# Altium schematic sheet Power Regulation.SchDoc
size A4; DrawnBy: Adam Szautner; Revision: 1.0; SheetNumber: 1; SheetTotal: 3; prg: Quantum Key Distribution; prj: Laser Driver; PN: QKD-LD-001; SPICEModelCacheNLWIOUNF: <root> / <DocumentId>NLWIOUNF</DocumentId> / <CacheFrame Number="0"> / <Model Name="emk325b7475_nht" Kind="CKT"> / <Text>* EMK325B7475_NHT     SPICE MODEL  ( General Type ) / *-------------------------------------------------------------------------------------------------------- / * Model Generated by TAIYO YUDEN Corporation (http://www.ty-top.com) / * Version 1.0 / * TAIYO YUDEN Control No. 170613 / * Copyright(c) 2017 TAIYO YUDEN CO.,LTD. All Rights Reserved. / *-------------------------------------------------------------------------------------------------------- / * / * Products Name : Multilayer Ceramic Capacitors / * / * Characteristics : / *     Capacitance : 4.7 uF , Rated Voltage : 16V , TCC : X7R / *     Case Size : 3.2 x 2.5 / 0.126 x 0.098 [mm/inch] , Thickness : 1.9 / 0.075 [mm/inch] / *     (Conditions: Temperature = 25 degC , DC Bias Current/Voltage = 0A / 0V) / * / * Frequency Range : 40Hz - 3GHz / * / * External Node Assignments : / * / *  1  o---| |---o  2 / * / *-------------------------------------------------------------------------------------------------------- / .SubCkt EMK325B7475_NHT 1 2 / **************************** / C0 1 110 4.4322u / Cm 1 101 0.18549u / C1 101 102 0.5166u / Rc1 101 102 1.212k / C2 102 103 0.23246u / Rc2 102 103 324.4 / C3 103 110 0.044161u / Rc3 103 110 17.632 / C2m 1 301 0.22169u / C21 301 302 1.4263u / Rc21 301 302 2.8865k / C22 302 303 0.94554u / Rc22 302 303 3.6708k / C23 303 304 0.89694u / Rc23 303 304 3.8182k / C24 304 305 0.63775u / Rc24 304 305 327.79 / C25 305 306 0.52201u / Rc25 305 306 313.07 / C26 306 307 0.23625u / Rc26 306 307 60.171 / C27 307 308 0.21382u / Rc27 307 308 30.452 / C28 308 309 0.12573u / Rc28 308 309 51.023 / C29 309 110 4272.8p / Rc29 309 110 13.367 / Rp0 1 110 106.382978723404Meg / L0 110 120 0.15544n / Lm 120 130 0.41806n / L1 120 121 0.46753n / RL1 121 130 0.26517 / L2 120 122 0.47905n / RL2 122 130 0.25841 / L3 120 123 0.81633n / RL3 123 130 40.755 / CR 120 124 1.2488u / LR 124 125 0.3236n / RR 125 130 24.837m / CL 130 140 3.3935p / LL 130 140 0.14146n / RL 130 140 14.873 / Rs 140 2 4.0745m / **************************** / .ends EMK325B7475_NHT</Text> / </Model> / </CacheFrame> / </root>
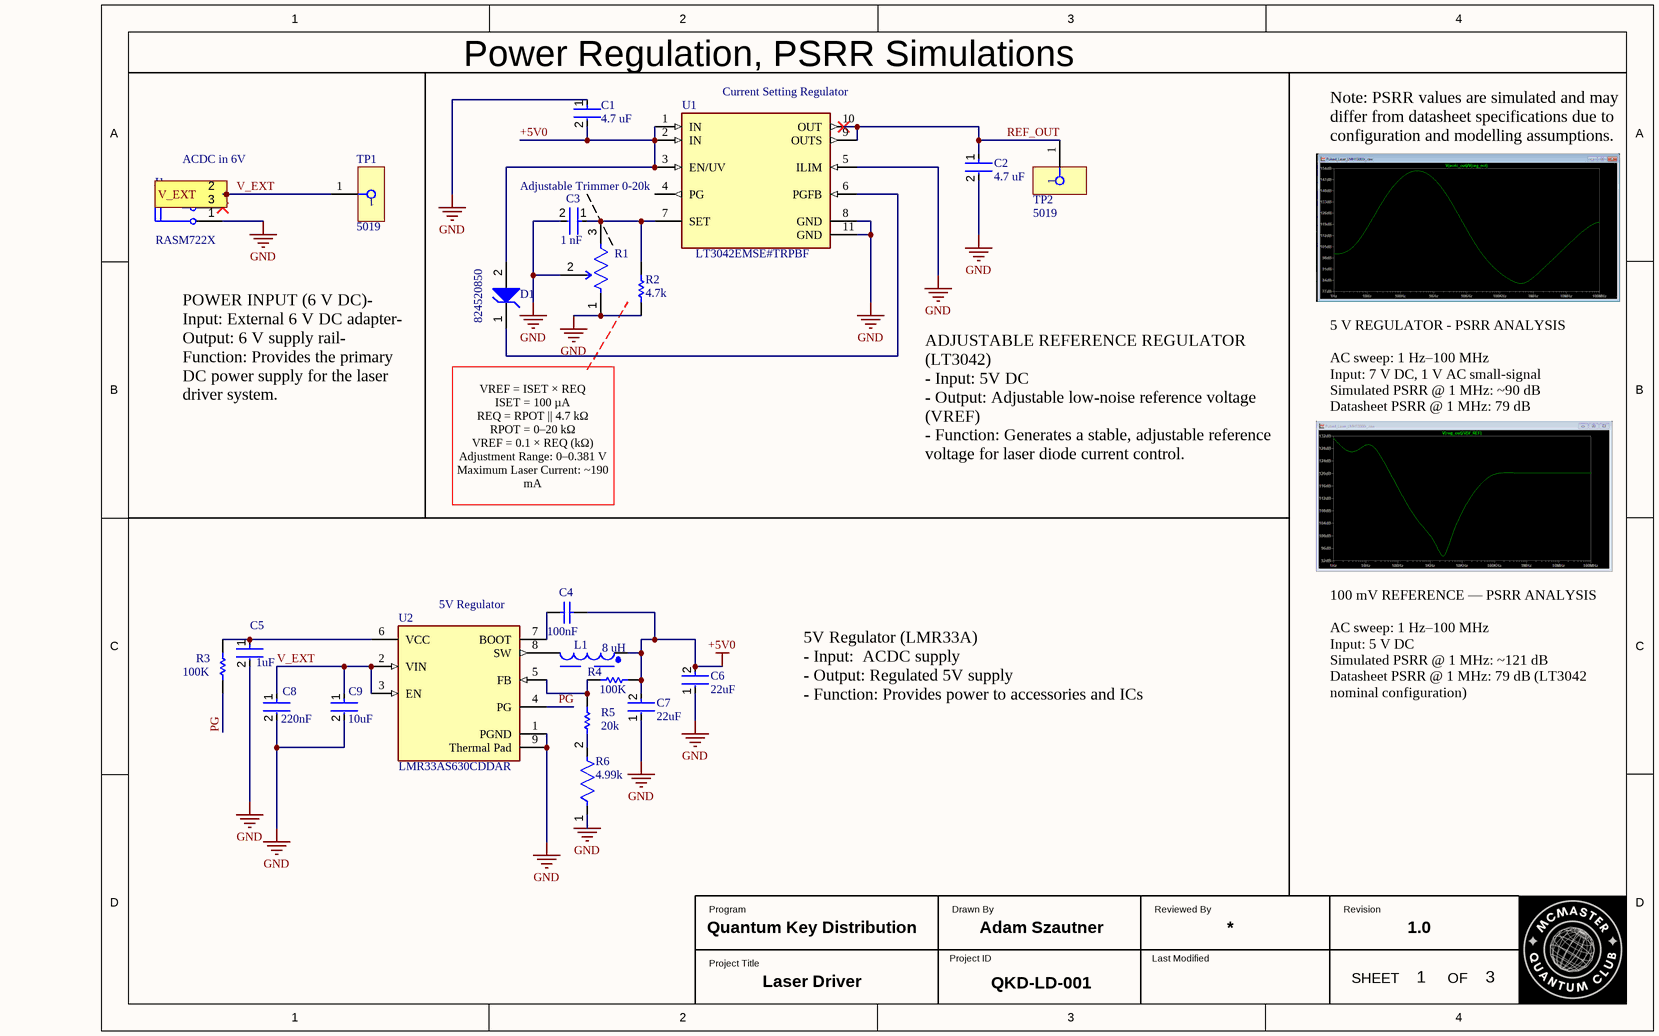
[diagram p0: Power Regulation.SchDoc]

## Parts
C1  4.7 uF  [FP-1210-L_3_2_0_3-W_2_5_0-MFG]
C2  4.7 uF  [FP-1210-L_3_2_0_3-W_2_5_0-MFG]
C3  1 nF  [FP-0201-L_0_6_0_03-W_0_3-IPC_C]
C4  100nF  [CAPC2013X145X50LL20T20]
C5  1uF  [FP-0402-L_1_0_0_05-W_0_5-IPC_B]
C6  22uF  [FP-GCM32E-0_35-e0_3_1_275-MFG]
C7  22uF  [FP-GCM32E-0_35-e0_3_1_275-MFG]
C8  220nF  [FP-C0603C-CF-MFG]
C9  10uF  [FP-GCJ31C-0_4-IPC_C]
D1  824520850  [WE-TVSP_DO-214AA_Unidirectional]
J1  RASM722X  [SWIT-RASM722X_V]
L1  8 uH  [WE-XHMI_1060 P]
R1  Adjustable Trimmer 0-20k  [FP-3269W-MFG]
R2  4.7k  [RESC1609X50X30NL10T20]
R3  100K  [RESC0603(1608)_N]
R4  100K  [RESC0603(1608)_N]
R5  20k  [RESC3116X65X40ML10T20]
R6  4.99k  [FP-CRCW1210-e3-IPC_B]
TP1  5019  [5019_MFG]
TP2  5019  [5019_MFG]
U1  LT3042EMSE#TRPBF  [FP-MSE-10-05-08-1664-IPC_A]
U2  LMR33AS630CDDAR  [FP-DDA0008J-IPC_B]

## Ports
V_EXT (in)

## Nets
+5V0: C1.2 C4.1 C6.2 C7.2 D1.2(A) L1.1 R4.2 U1.1(IN) U1.2(IN) U1.3(EN/UV)
GND: C1.1 C2.2 C3.2 C5.2 C6.1 C7.1 C8.2 C9.2 J1.1(SLEEVE) R1.1(CCW) R1.2(WIPER) R2.1 R6.1 U1.5(ILIM) U1.8(GND) U1.11(GND) U2.1(PGND) U2.9(Thermal_Pad)
PG: R3.1 U2.4(PG)
REF_OUT: C2.1 TP2.1 U1.9(OUTS) U1.10(OUT)
V_EXT: C8.1 C9.1 J1.2(TIP) TP1.1 U2.2(VIN) U2.3(EN) ; port V_EXT
NetC3_1: C3.1 R1.3(CW) R2.2 U1.7(SET)
NetC4_2: C4.2 U2.7(BOOT)
NetC5_1: C5.1 R3.2 U2.6(VCC)
NetD1_1: D1.1(K) U1.6(PGFB)
NetL1_2: L1.2 U2.8(SW)
NetR4_1: R4.1 R5.2 U2.5(FB)
NetR5_1: R5.1 R6.2

Not connected (* = marked no-connect by the designer): J1 3(SHUNT)*; U1 4(PG)

## Notes on the sheet
- Power Regulation, PSRR Simulations
- (near U1) Current Setting Regulator
- (near J1) ACDC in 6V
- Note: PSRR values are simulated and may differ from datasheet specifications due to configuration and modelling assumptions.
- POWER INPUT (6 V DC)- Input: External 6 V DC adapter- Output: 6 V supply rail- Function: Provides the primary DC power supply for the laser driver system.
- 5 V REGULATOR - PSRR ANALYSIS
  AC sweep: 1 Hz–100 MHz
  Input: 7 V DC, 1 V AC small-signal
  Simulated PSRR @ 1 MHz: ~90 dB
  Datasheet PSRR @ 1 MHz: 79 dB
- VREF = ISET × REQ
  ISET = 100 µA
  REQ = RPOT || 4.7 kΩ
  RPOT = 0–20 kΩ
  VREF = 0.1 × REQ (kΩ)
  Adjustment Range: 0–0.381 V
  Maximum Laser Current: ~190 mA
- ADJUSTABLE REFERENCE REGULATOR (LT3042)
  - Input: 5V DC
  - Output: Adjustable low-noise reference voltage (VREF)
  - Function: Generates a stable, adjustable reference voltage for laser diode current control.
- (near U2) 5V Regulator
- 100 mV REFERENCE — PSRR ANALYSIS
  AC sweep: 1 Hz–100 MHz
  Input: 5 V DC
  Simulated PSRR @ 1 MHz: ~121 dB
  Datasheet PSRR @ 1 MHz: 79 dB (LT3042 nominal configuration)
- 5V Regulator (LMR33A)
  - Input:  ACDC supply
  - Output: Regulated 5V supply
  - Function: Provides power to accessories and ICs
- Program
- Drawn By
- Reviewed By
- Revision
- Project Title
- Project ID
- Last Modified
- SHEET
- OF

## Library data of the parts
C1 C2 = CMP-14477-002952-2: None; RoHS Compliant: Yes
C3 = CMP-14477-001812-1: Ceramic Capacitor General Use 1000pF ±20% 10V X7R 0201
C4 = CMP-2007-01396-1: Part Number: VJ0805Y104JXXPW1BC; Manufacturer: Vitramon
C5 = CMP-14477-002459-2: None
C6 C7 = CMP-06035-055667-1: Ceramic Capacitor for Automotive 22uF ±10% 25VDC X8L 1210 Embossed T/R
C8 = CMP-03020-026996-1: C0603 0.22 μF X7R 30ppm/°C 10.00% 10 V; Manufacturer Part Number: C0603C224K8RAC; Manufacturer: KEMET; Capacitance: 0.22 μF; Automotive Grade: Grade 1; Material: Ceramic; Value: 0.22 μF; Voltage Rating: 10 V; Tolerance: 0.1; Device Class L2: Capacitors; Temperature Range High: +125°C; RoHS: TRUE; Device Class L1: Passive Components; Temperature: -55°C to +125°C; Temperature Coefficient: 30ppm/°C; ComponentLink2Description: Datasheet; Device Class L3: Ceramic Capacitors; ComponentLink2URL: https://api.kemet.com/component-edge/download/datasheet/C0603C100J5GACAUTO.pdf; Category: Cap; Lead Free: Yes; Automotive: Yes; Height: 0.87mm; Temperature Characteristic: X7R; Mouser Description: Multilayer Ceramic Capacitors MLCC - SMD/SMT 50volts 0.22 uF C0G X7R; Octopart: https://octopart.com/c0603c224k8rac-kemet-7455784; Package: C0603C-CF; Temperature Range Low: -55°C
C9 = CMP-06035-004889-1: Cap Ceramic 10uF 35V X7T 10% SMD 1206 +125°C Embossed Plastic T/R
D1 = CMP-03913-71101611-2: Tvs Diode, 600W, 8.5V, Unidir, Do-214Aa; Max Breakdown Voltage: 9.92V; Leakage Current: 20µA; Number of Unidirectional Channels: 1; Polarity: Unidirectional; Peak Pulse Current: 41.7A; Clamping Voltage: 14.4V; Power Line Protection: No; Packaging: Cut Tape; Min Operating Temperature: -65°C; Reverse Standoff Voltage: 8.5V; Max Operating Temperature: 150°C; Composition: Zener; RoHS: Compliant; Width: 3.62mm; Length: 4.32mm; Peak Pulse Power: 600W; Min Breakdown Voltage: 9.92V; REACH SVHC: Unknown; Number of Pins: 2; Mount: Surface Mount; Height: 2.4mm
J1 = CMP-1772-00002-1: Power Jack, 5 A, 250 V, 3-Pin SMD, RoHS, Bulk; ComponentLink1URL: http://www.switchcraft.com/; ComponentLink2URL: http://www.switchcraft.com/Drawings/rasm732x_cd.pdf; ComponentLink1Description: Manufacturer URL; PackageReference: RASM722X; ComponentLink2Description: Datasheet; DatasheetVersion: Rev. A, 09/2005; PackageDescription: 3-Pin Surface Mount Device, Body 14.5 x 9 mm
L1 = CMP-03913-166631046-1: Smd Pwr Ind, 8.2Uh, 19.4A, Shielded/4540 Rohs Compliant: Yes
R1 = CMP-07234-000026-1: TRIMMER 200 OHM 0.25W GW TOP ADJ; Power Rating: 250mW; Temperature Coefficient: 100ppm/°C; Tolerance: 10%; Number of Turns: 12; Resistance: 200R; Packaging: Tape and Reel; Military Standard: Not; Length: 6.35mm; Package Quantity: 1; RoHS Compliant: Yes; Radiation Hardening: No; Height: 0.293inch; Max Power Dissipation: 250mW; Series: Trimpot® 3269 - Sealed; Resistor Type: Cermet; Mount: Surface Mount; Technology: CERMET; Min Operating Temperature: -65°C; Weight: 0.425g; Max Operating Temperature: 150°C; Taper: Linear; Depth: 6.36mm; Width: 0.17inch; Termination: Gull Wing
R2 = CMP-2000-03412-1: Manufacturer: Vishay Dale; Part Number: CRCW06034K70FKTA
R3 R4 = CMP-1012-00736-1: 100K 0.1W 1% 0603 (1608 Metric)  SMD; Value: 100000.00 Ohm; Case-Metric: 1608; Case-EIA: 0603; Power: 0.1 W; Tolerance: 1 %; Technology: SMT
R5 = CMP-2003-04939-1: Part Number: RC1206FR-1320KL; Manufacturer: Yageo
R6 = CMP-2005-00078-2: RES SMD 205K OHM 1% 1/2W 2088; Max Power Dissipation: 500mW; Voltage Rating: 200V; Resistance: 4.99kR; Temperature Coefficient: 100ppm/°C; Case Code (Imperial): 1210; Weight: 0.000564oz; Length: 0.126inch; Case Code (Metric): 3225; Lead Free: Lead Free; Features: Automotive AEC-Q200; Case/Package: 1210; Height: 0.024inch; Number of Terminations: 2; Number of Pins: 2; Composition: Thick Film; Max Operating Temperature: 155°C; Min Operating Temperature: -55°C; Width: 2.5mm; Voltage Rating (DC): 200V; Termination: SMD/SMT; Package Quantity: 1; Power Rating: 500mW; Tolerance: 1%; Packaging: Tape and Reel; Contact Plating: Tin
TP1 TP2 = CMP-1672-00008-3: Phosphor Bronze Contact Miniature Silver Plated Surface Mount Test Points; Number of Contacts: 1; ComponentLink1Description: Manufacturer's Website; Number of Pins: 1; Height: 2.42mm; Mount: Surface Mount; HelpURL: https://www.keyelco.com/product-pdf.cfm?p=1357; REACH SVHC: Yes; Packaging: Tape and Reel; Lead Free: Lead Free; ComponentLink1URL: http://www.keyelco.com/; Termination: SMD/SMT; Material: Bronze; Contact Plating: Silver; Contact Material: Silver; RoHS: Compliant; ComponentLink2URL: https://www.keyelco.com/product-pdf.cfm?p=1357; China RoHS: Compliant; Lifecycle Status: Production; ComponentLink2Description: Datasheet URL
U1 = CMP-09138-000250-1: IC REG LIN POS ADJ 200MA 10MSOP; Dropout Voltage: 350mV; Number of Regulators: 1; Output Voltage: 15V; Min Current Limit: 220mA; Output Current: 200mA; Series: -; Packaging: Tape and Reel; Mount: Surface Mount; RoHS Compliant: Yes; Max Operating Temperature: 125°C; Number of Pins: 10; Case/Package: MSOP; Min Operating Temperature: -40°C
U2 = CMP-04918-000348-1: IC REG BUCK ADJUSTABLE 3A 8SOPWR; Synchronous Rectifier: Yes; Number of Outputs: 1; Min Output Voltage: 1V; Switching Frequency: 2.1MHz; Max Output Voltage: 24V; Output Configuration: Positive; Max Input Voltage: 36V; Min Input Voltage: 3.8V; Max Operating Temperature: 125°C; Mount: Surface Mount; Min Operating Temperature: -40°C; Number of Pins: 8; Output Current: 3A; RoHS Compliant: Yes; Output Type: Adjustable; Packaging: Tape and Reel